# Altium schematic sheet Connector_Sheet_2.SchDoc
size A4; SheetNumber: 3; SheetTotal: 12
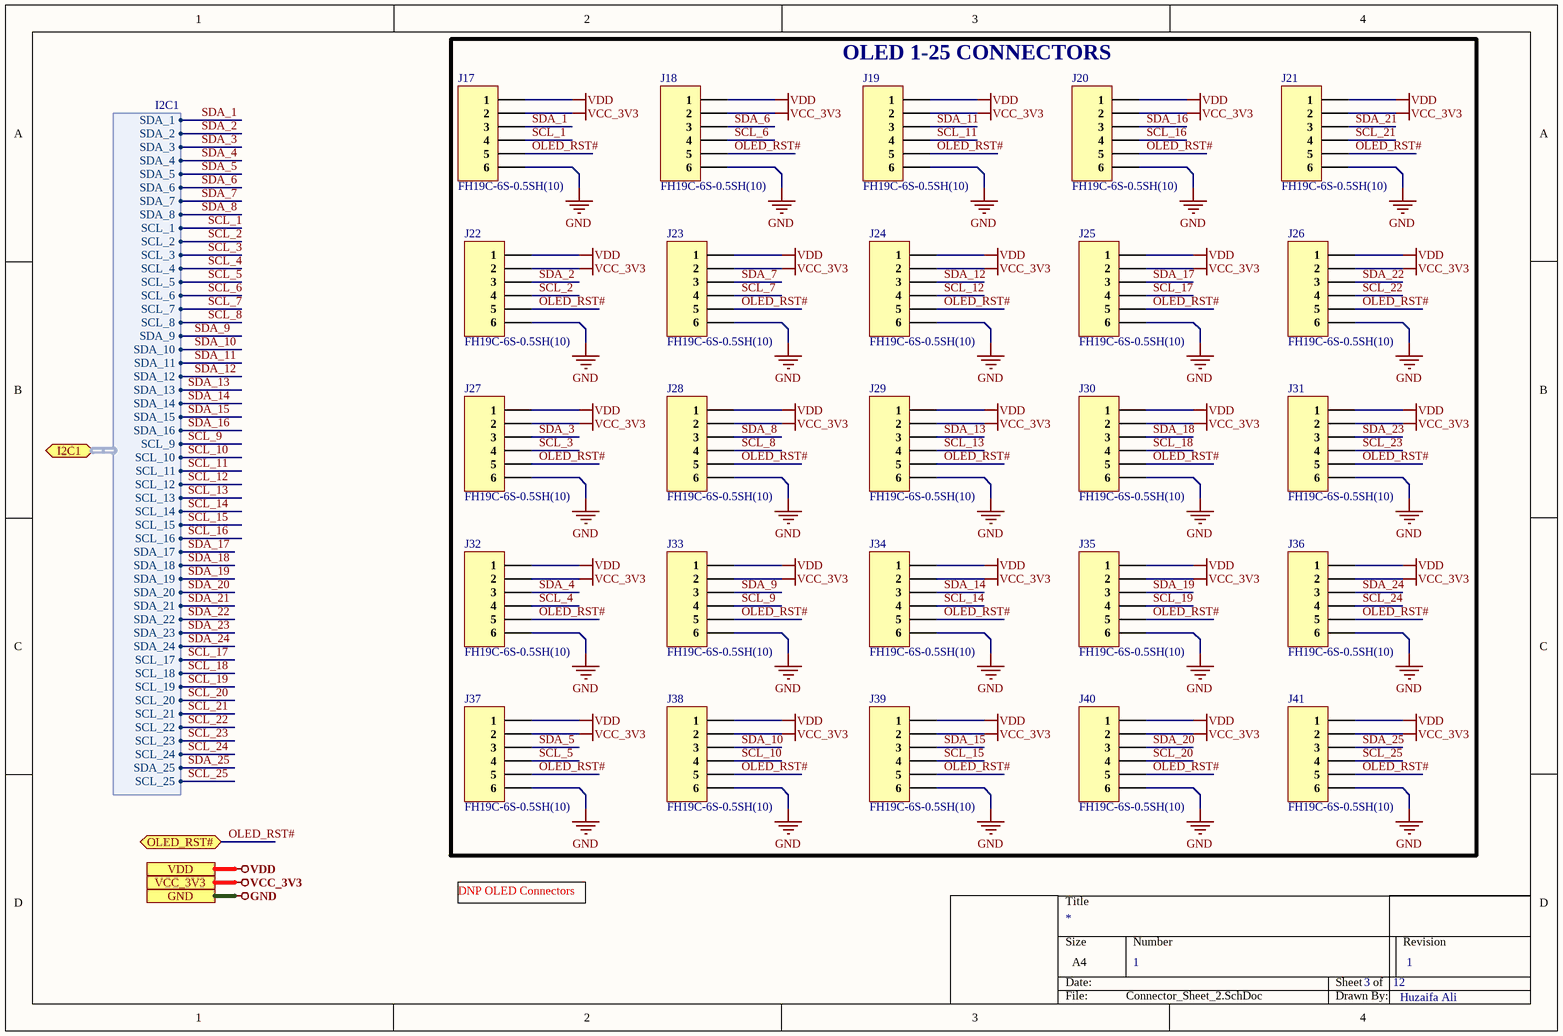
[diagram p0: Connector_Sheet_2.SchDoc]

## Parts
J17  FH19C-6S-0.5SH(10)  [FH19C-6S-0.5SH(10)]
J18  FH19C-6S-0.5SH(10)  [FH19C-6S-0.5SH(10)]
J19  FH19C-6S-0.5SH(10)  [FH19C-6S-0.5SH(10)]
J20  FH19C-6S-0.5SH(10)  [FH19C-6S-0.5SH(10)]
J21  FH19C-6S-0.5SH(10)  [FH19C-6S-0.5SH(10)]
J22  FH19C-6S-0.5SH(10)  [FH19C-6S-0.5SH(10)]
J23  FH19C-6S-0.5SH(10)  [FH19C-6S-0.5SH(10)]
J24  FH19C-6S-0.5SH(10)  [FH19C-6S-0.5SH(10)]
J25  FH19C-6S-0.5SH(10)  [FH19C-6S-0.5SH(10)]
J26  FH19C-6S-0.5SH(10)  [FH19C-6S-0.5SH(10)]
J27  FH19C-6S-0.5SH(10)  [FH19C-6S-0.5SH(10)]
J28  FH19C-6S-0.5SH(10)  [FH19C-6S-0.5SH(10)]
J29  FH19C-6S-0.5SH(10)  [FH19C-6S-0.5SH(10)]
J30  FH19C-6S-0.5SH(10)  [FH19C-6S-0.5SH(10)]
J31  FH19C-6S-0.5SH(10)  [FH19C-6S-0.5SH(10)]
J32  FH19C-6S-0.5SH(10)  [FH19C-6S-0.5SH(10)]
J33  FH19C-6S-0.5SH(10)  [FH19C-6S-0.5SH(10)]
J34  FH19C-6S-0.5SH(10)  [FH19C-6S-0.5SH(10)]
J35  FH19C-6S-0.5SH(10)  [FH19C-6S-0.5SH(10)]
J36  FH19C-6S-0.5SH(10)  [FH19C-6S-0.5SH(10)]
J37  FH19C-6S-0.5SH(10)  [FH19C-6S-0.5SH(10)]
J38  FH19C-6S-0.5SH(10)  [FH19C-6S-0.5SH(10)]
J39  FH19C-6S-0.5SH(10)  [FH19C-6S-0.5SH(10)]
J40  FH19C-6S-0.5SH(10)  [FH19C-6S-0.5SH(10)]
J41  FH19C-6S-0.5SH(10)  [FH19C-6S-0.5SH(10)]

## Blocks framed on the sheet
OLED 1-25 CONNECTORS: J17-J41

## Ports
GND, I2C1 (bidir, harness I2C1), OLED_RST# (bidir), VCC_3V3, VDD

## Harnesses
I2C1: SDA_1, SDA_2, SDA_3, SDA_4, SDA_5, SDA_6, SDA_7, SDA_8, SCL_1, SCL_2, SCL_3, SCL_4, SCL_5, SCL_6, SCL_7, SCL_8, SDA_9, SDA_10, SDA_11, SDA_12, SDA_13, SDA_14, SDA_15, SDA_16, SCL_9, SCL_10, SCL_11, SCL_12, SCL_13, SCL_14, SCL_15, SCL_16, SDA_17, SDA_18, SDA_19, SDA_20, SDA_21, SDA_22, SDA_23, SDA_24, SCL_17, SCL_18, SCL_19, SCL_20, SCL_21, SCL_22, SCL_23, SCL_24, SDA_25, SCL_25

## Nets
GND: J17.6 J18.6 J19.6 J20.6 J21.6 J22.6 J23.6 J24.6 J25.6 J26.6 J27.6 J28.6 J29.6 J30.6 J31.6 J32.6 J33.6 J34.6 J35.6 J36.6 J37.6 J38.6 J39.6 J40.6 J41.6 ; port GND
VCC_3V3: J17.2 J18.2 J19.2 J20.2 J21.2 J22.2 J23.2 J24.2 J25.2 J26.2 J27.2 J28.2 J29.2 J30.2 J31.2 J32.2 J33.2 J34.2 J35.2 J36.2 J37.2 J38.2 J39.2 J40.2 J41.2 ; port VCC_3V3
VDD: J17.1 J18.1 J19.1 J20.1 J21.1 J22.1 J23.1 J24.1 J25.1 J26.1 J27.1 J28.1 J29.1 J30.1 J31.1 J32.1 J33.1 J34.1 J35.1 J36.1 J37.1 J38.1 J39.1 J40.1 J41.1 ; port VDD
OLED_RST#: J17.5 J18.5 J19.5 J20.5 J21.5 J22.5 J23.5 J24.5 J25.5 J26.5 J27.5 J28.5 J29.5 J30.5 J31.5 J32.5 J33.5 J34.5 J35.5 J36.5 J37.5 J38.5 J39.5 J40.5 J41.5 ; port OLED_RST#
SCL_1: J17.4 ; port I2C1.SCL_1
SCL_2: J22.4 ; port I2C1.SCL_2
SCL_3: J27.4 ; port I2C1.SCL_3
SCL_4: J32.4 ; port I2C1.SCL_4
SCL_5: J37.4 ; port I2C1.SCL_5
SCL_6: J18.4 ; port I2C1.SCL_6
SCL_7: J23.4 ; port I2C1.SCL_7
SCL_8: J28.4 ; port I2C1.SCL_8
SCL_9: J33.4 ; port I2C1.SCL_9
SCL_10: J38.4 ; port I2C1.SCL_10
SCL_11: J19.4 ; port I2C1.SCL_11
SCL_12: J24.4 ; port I2C1.SCL_12
SCL_13: J29.4 ; port I2C1.SCL_13
SCL_14: J34.4 ; port I2C1.SCL_14
SCL_15: J39.4 ; port I2C1.SCL_15
SCL_16: J20.4 ; port I2C1.SCL_16
SCL_17: J25.4 ; port I2C1.SCL_17
SCL_18: J30.4 ; port I2C1.SCL_18
SCL_19: J35.4 ; port I2C1.SCL_19
SCL_20: J40.4 ; port I2C1.SCL_20
SCL_21: J21.4 ; port I2C1.SCL_21
SCL_22: J26.4 ; port I2C1.SCL_22
SCL_23: J31.4 ; port I2C1.SCL_23
SCL_24: J36.4 ; port I2C1.SCL_24
SCL_25: J41.4 ; port I2C1.SCL_25
SDA_1: J17.3 ; port I2C1.SDA_1
SDA_2: J22.3 ; port I2C1.SDA_2
SDA_3: J27.3 ; port I2C1.SDA_3
SDA_4: J32.3 ; port I2C1.SDA_4
SDA_5: J37.3 ; port I2C1.SDA_5
SDA_6: J18.3 ; port I2C1.SDA_6
SDA_7: J23.3 ; port I2C1.SDA_7
SDA_8: J28.3 ; port I2C1.SDA_8
SDA_9: J33.3 ; port I2C1.SDA_9
SDA_10: J38.3 ; port I2C1.SDA_10
SDA_11: J19.3 ; port I2C1.SDA_11
SDA_12: J24.3 ; port I2C1.SDA_12
SDA_13: J29.3 ; port I2C1.SDA_13
SDA_14: J34.3 ; port I2C1.SDA_14
SDA_15: J39.3 ; port I2C1.SDA_15
SDA_16: J20.3 ; port I2C1.SDA_16
SDA_17: J25.3 ; port I2C1.SDA_17
SDA_18: J30.3 ; port I2C1.SDA_18
SDA_19: J35.3 ; port I2C1.SDA_19
SDA_20: J40.3 ; port I2C1.SDA_20
SDA_21: J21.3 ; port I2C1.SDA_21
SDA_22: J26.3 ; port I2C1.SDA_22
SDA_23: J31.3 ; port I2C1.SDA_23
SDA_24: J36.3 ; port I2C1.SDA_24
SDA_25: J41.3 ; port I2C1.SDA_25

## Notes on the sheet
- DNP OLED Connectors
- 1
- Huzaifa Ali

## Library data of the parts
J17-J41 = FH19C-6S-0.5SH(10): 0.5mm Pitch, 0.9mm Height, No of Contact 4-50, FPC/FFC Connector, 0.5 A, -55 to 85 ℃, RoHS; Manufacturer: Hirose; Supplier 1: Digi-Key; Manufacturer Part Number: FH19C-6S-0.5SH(10); RoHS: Yes; Category: FFC / FPC; Stock 1: 1159; Pricing 1: 1=1.10000, 10=0.96900, 25=0.91200, 50=0.87400, 100=0.83600, 250=0.76000, 500=0.68400, 1000=0.60800, 2500=0.55100 (USD); ComponentLink1URL: https://datasheet.ciiva.com/18563/ed-fh19cfh19sc-20140305-18563530.pdf?src-supplier=Digi-Key; ComponentLink1Description: https://datasheet.ciiva.com/18563/ed-fh19cfh19sc-20140305-18563530.pdf?src-supplier=Digi-Key; Supplier Part Number 1: H125824CT-ND